# EasyEDA Pro project esp32s3clock.epro, board PCB1
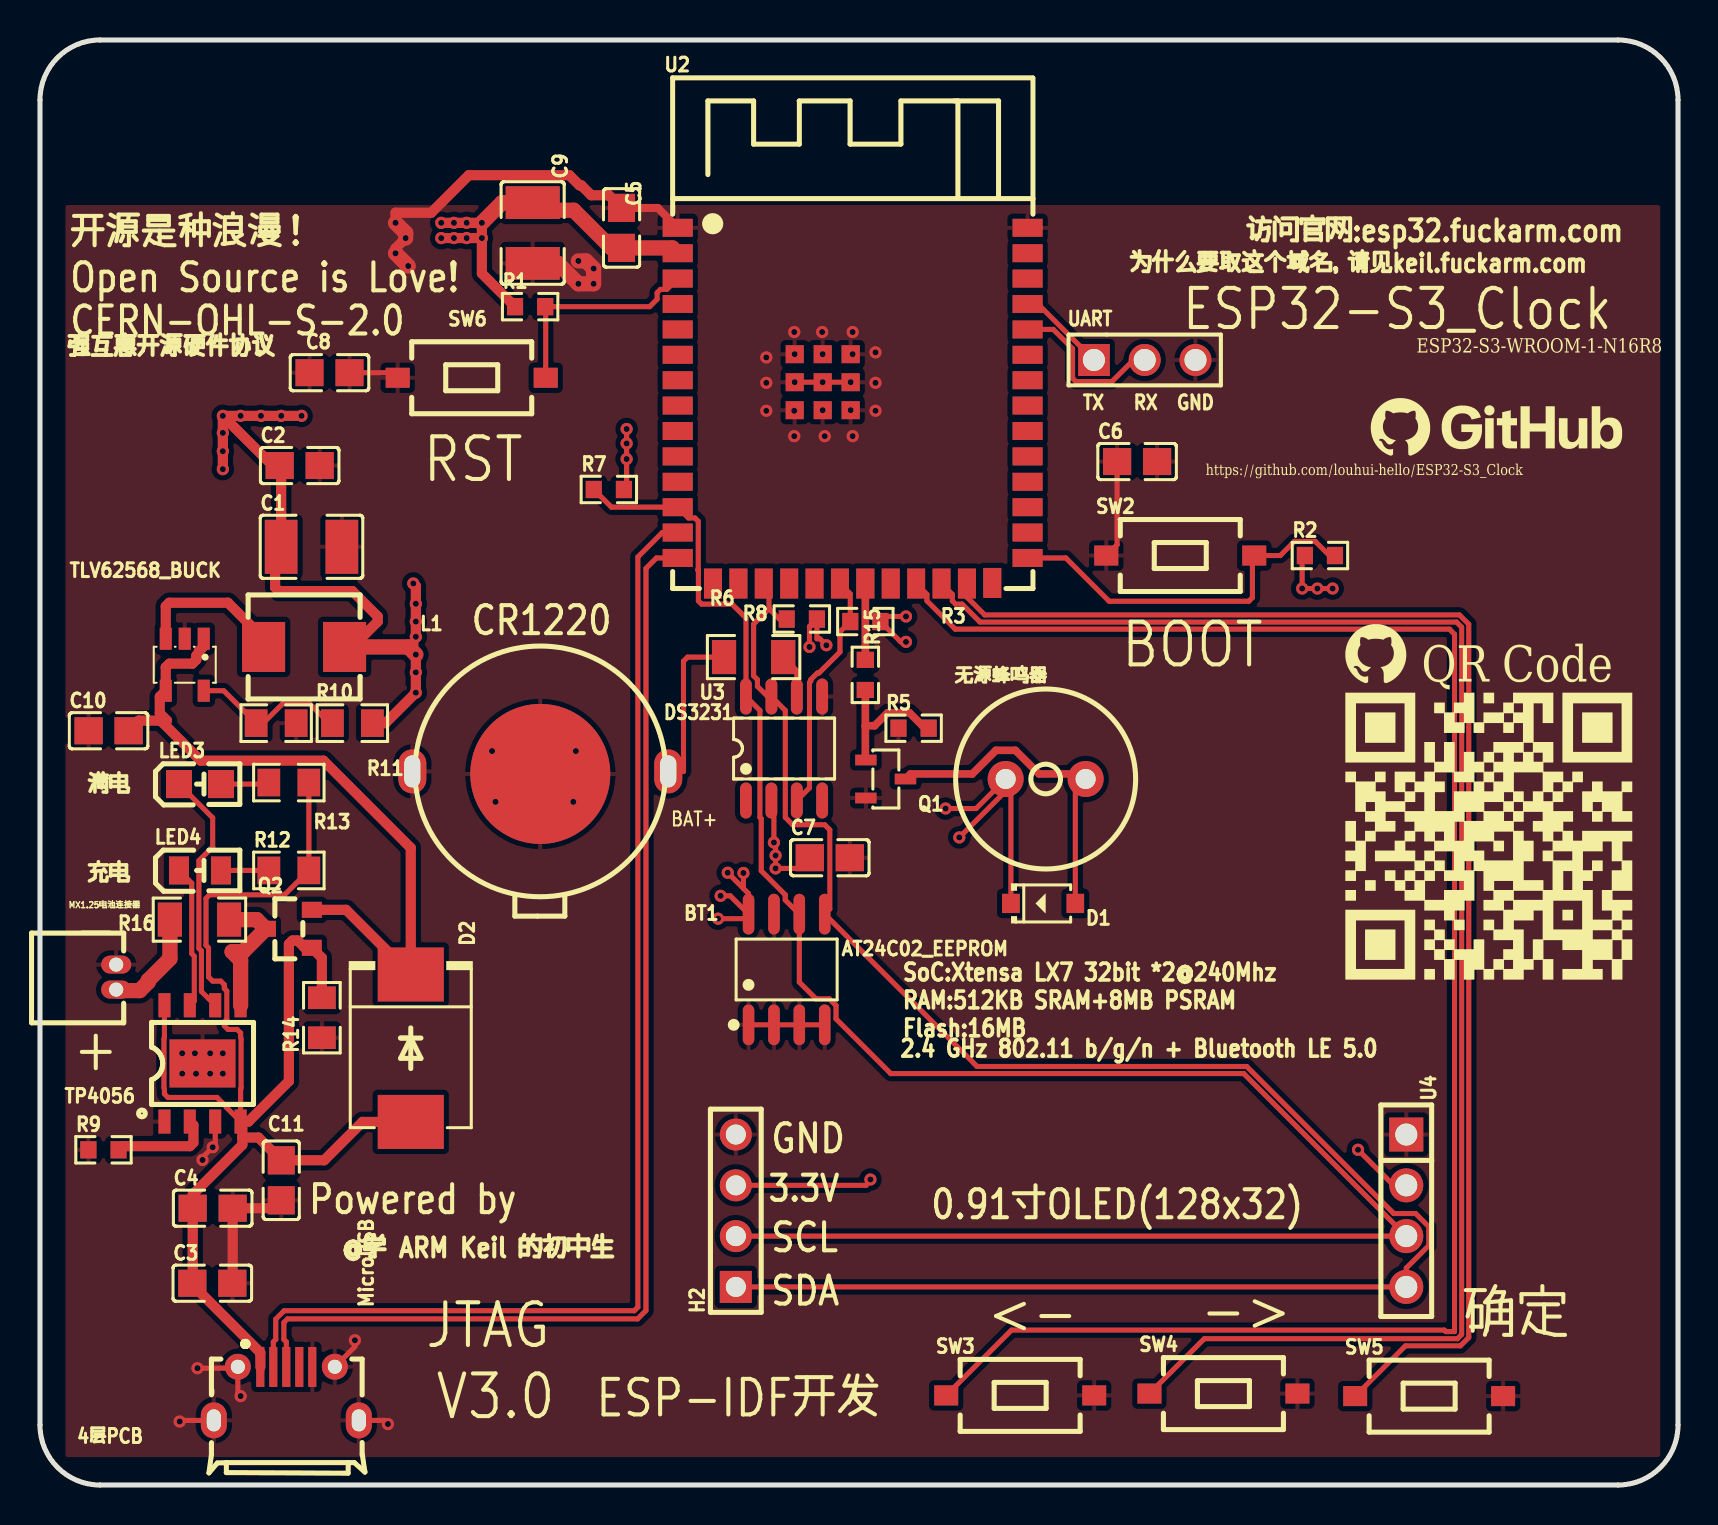
[diagram p5: board, top side]
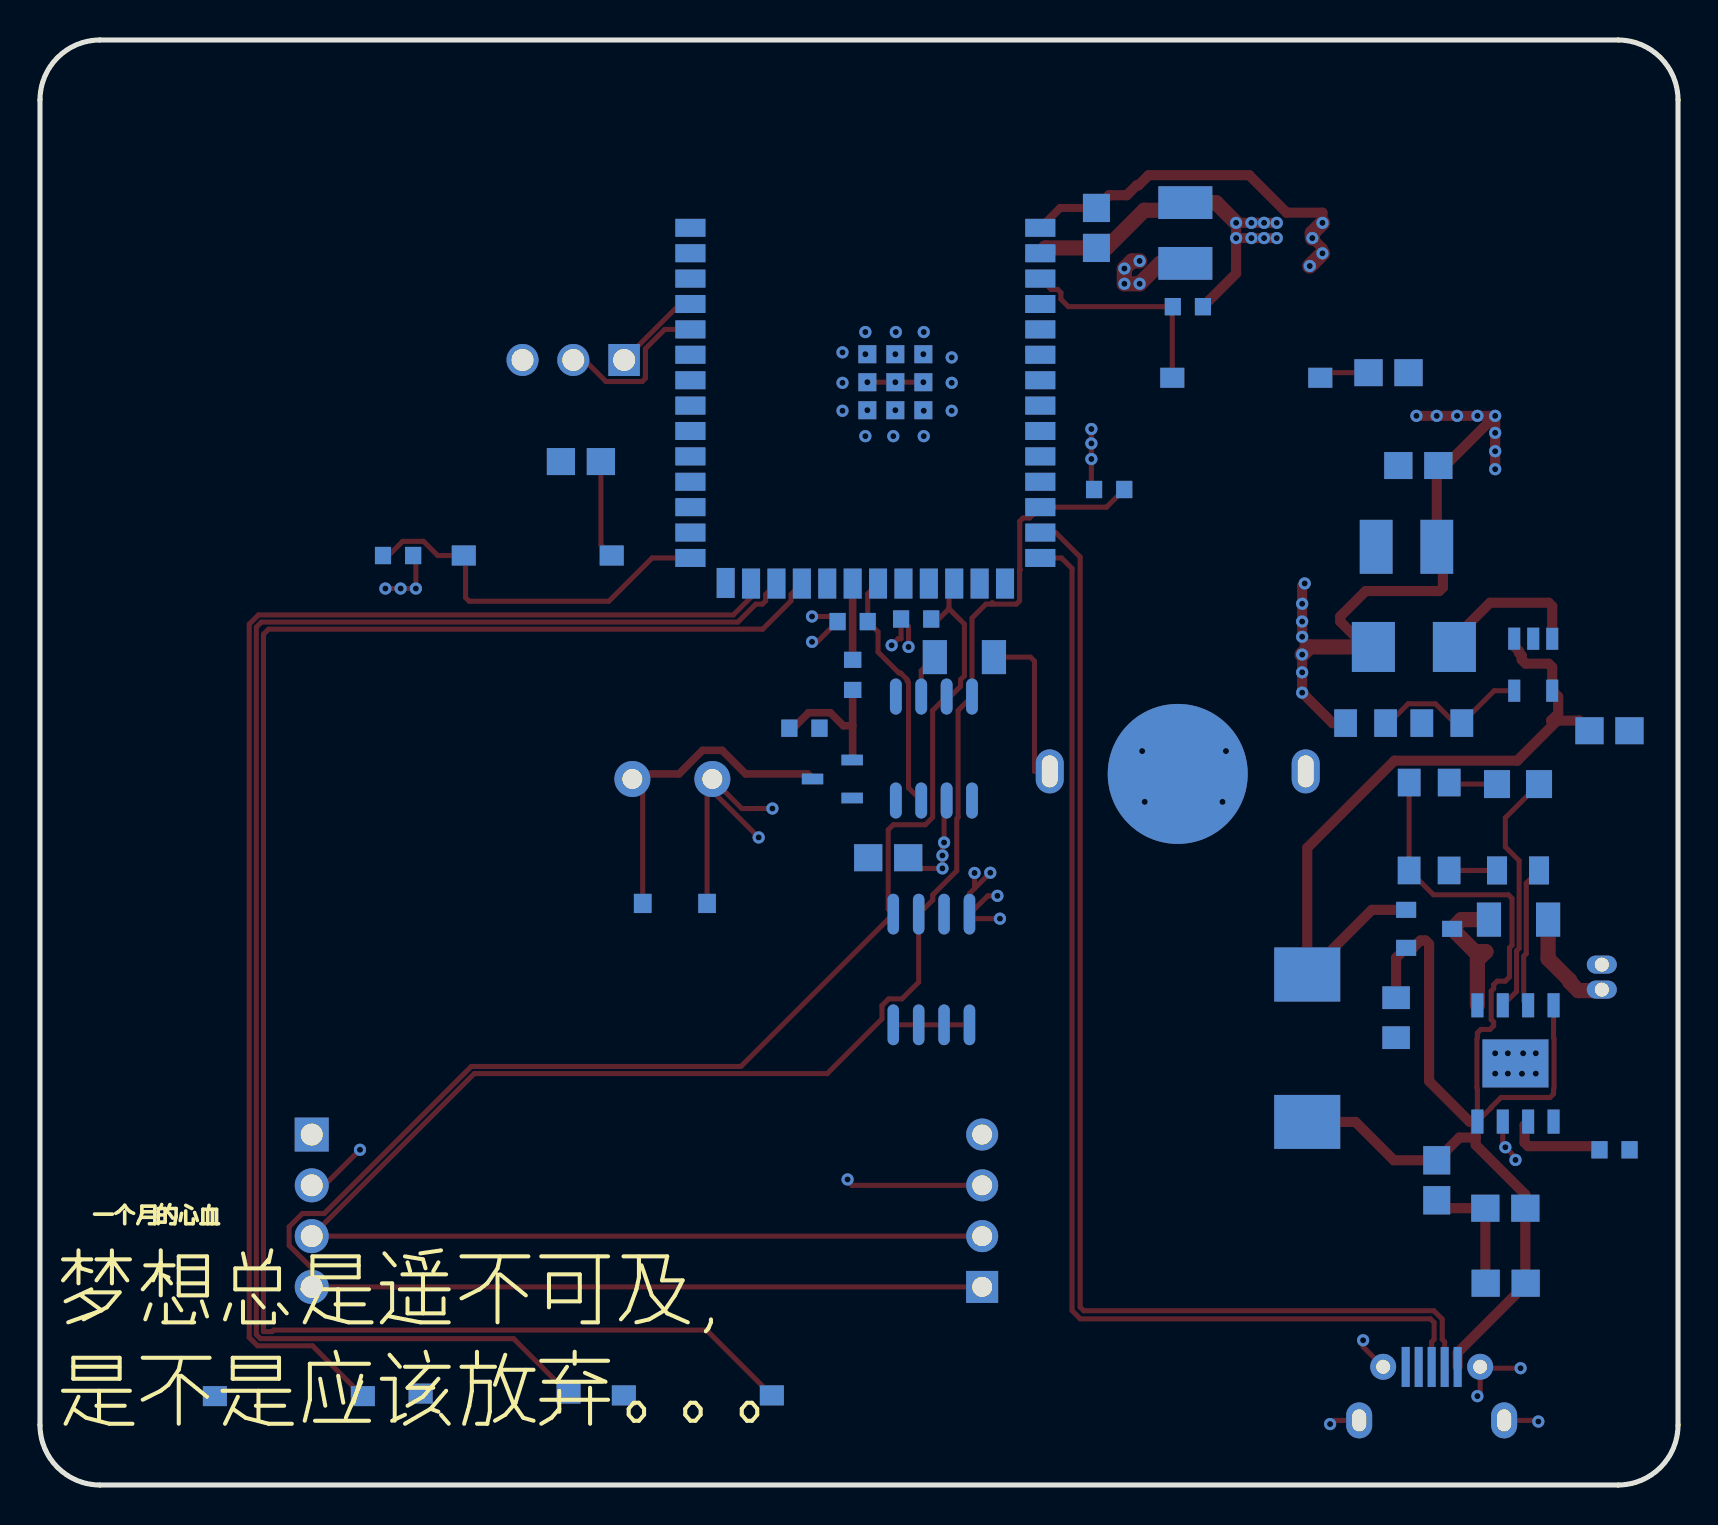
[diagram p6: board, bottom side, seen from below]

Outline 81.91 x 72.26 mm; copper layers: Top Layer, Inner1, Inner2, Bottom Layer. Coordinates in mm from the lower left corner of the outline.
Outline path: 0,69.26 0,3 arc(0.88,0.88) 3,0 78.91,0 arc(81.04,0.88) 81.91,3 81.91,69.26 arc(81.04,71.38) 78.91,72.26 3,72.26 arc(0.88,71.38) 0,69.26
Stack: Top Layer 0.035mm Outer layer thickness 1oz / Dielectric1 0.2104mm 7628 RC49% 8.6mil er 4.4 / Inner1 0.0152mm Inner layer thickness / Dielectric2 1.065mm 1.1mm H/HOZ Copper er 4.43 / Inner2 0.0152mm Inner layer thickness / Dielectric3 0.2104mm 7628 RC49% 8.6mil er 4.4 / Bottom Layer 0.035mm Outer layer thickness 1oz

## Design rules (mm)
net D-: DP1
net D+: DP1
spacing copperThickness1oz (default): track to track 0.102, other pairs 0.152 to 0.3
spacing copperThickness2oz: track to track 0.203, other pairs 0.152 to 0.3
track width copperThickness1oz (default): min 0.127, default 0.254, max 2.54
track width copperThickness2oz: min 0.203, default 0.254, max 2.54
differential pair differentialPair (default): width min 0.127, default 0.254, max 2.54; gap min 0.152, default 0.152
net 3.3V uses copperRegion
net GND uses copperRegion

## Placement (name value [footprint] x y rotation side)
AT24C02_EEPROM  AT24C02  [SOP-8_L5.0-W4.0-P1.27-LS6.0-BL]  37.34 25.78 0 top
BT1  LAIL-CR1220-MO-02  [BAT_TH_LAIL-CR1220-MO-02]  25.02 35.69 180 top
C1  22uF  [C1210]  13.58 46.92 0 top
C2  100nF  [C0805]  12.99 50.98 0 top
C3  22uF  [C0805]  8.62 10.09 0 top
C4  100nF  [C0805]  8.64 13.84 0 top
C5  100nF  [C0805]  29.08 62.86 270 top
C6  100nF  [C0805]  54.86 51.18 0 top
C7  100nF  [C0805]  39.5 31.37 0 top
C8  100nF  [C0805]  14.48 55.63 0 top
C9  22uF  [C1210]  24.64 62.61 270 top
C10  10uF  [C0805]  3.43 37.72 0 top
C11  10uF  [C0805]  12.06 15.24 90 top
D1  1N4148W  [SOD-123_L2.7-W1.6-LS3.7-FD]  50.16 29.08 180 top
D2  SS34  [SMC_L6.9-W5.9-LS7.9-RD]  18.54 21.84 270 top
H1  LAIL-PZ2.54-3P-L  [HDR-TH_3P-P2.54-V-M-1]  55.25 56.26 0 top
H2  LAIL-PZ2.54-4P-L  [CONN-TH_LAIL-PZ2.54-4P-L]  34.8 13.72 90 top
L1  DH0520H-2R2M  [IND-SMD_L5.6-W5.2_MST0530H-150M]  13.21 41.91 180 top
LED3  GL0805UG01  [LED0805-FD_GL0805UG01]  8 35.05 180 top
LED4  GL0805UR01  [LED0805-R-RD_RED]  8 30.73 0 top
MicroUSB  MicroXNJ  [MICRO-USB-SMD_MICROXNJ_1]  12.32 4.57 270 top
MX1.25电池连接器  ZX-MX1.25-2PWZ  [CONN-TH_2P-P1.25_ZX-MX1.25-2PWZ]  3.81 25.4 270 top
NOREF  -  [Pad_e793]  25.02 35.56 0 top
Q1  S8050  [SOT-23-3_L2.9-W1.3-P1.90-LS2.3-BR]  42.29 35.31 180 top
Q2  AO3401A  [SOT-23_L2.9-W1.3-P1.90-LS2.4-BR]  12.45 27.81 0 top
R1  10kΩ  [R0603]  24.51 58.93 0 top
R2  10kΩ  [R0603]  64.01 46.48 0 top
R3  10kΩ  [R0603]  41.28 43.18 180 top
R5  10kΩ  [R0603]  43.69 37.85 0 top
R6  0Ω  [R1206]  35.69 41.4 180 top
R7  4.7kΩ  [R0603]  28.45 49.78 0 top
R8  4.7kΩ  [R0603]  38.1 43.31 0 top
R9  2.4kΩ  [R0603]  3.17 16.76 0 top
R10  100kΩ  [R0805]  15.62 38.1 0 top
R11  22kΩ  [R0805]  11.81 38.1 0 top
R12  1kΩ  [R0805]  12.45 30.73 0 top
R13  1kΩ  [R0805]  12.44 35.13 0 top
R14  100kΩ  [R0805]  14.1 23.37 90 top
R15  1kΩ  [R0603]  41.28 40.51 270 top
R16  0Ω  [R1206]  7.98 28.27 0 top
SW2  TS-1101-C-W  [SW-SMD_L6.0-W3.3-LS8.0_TS-1101-C-W]  57.02 46.48 0 top
SW3  TS-1101-C-W  [SW-SMD_L6.0-W3.3-LS8.0_TS-1101-C-W]  49.02 4.48 0 top
SW4  TS-1101-C-W  [SW-SMD_L6.0-W3.3-LS8.0_TS-1101-C-W]  59.18 4.57 0 top
SW5  TS-1101-C-W  [SW-SMD_L6.0-W3.3-LS8.0_TS-1101-C-W]  69.47 4.44 0 top
SW6  TS-1101-C-W  [SW-SMD_L6.0-W3.3-LS8.0_TS-1101-C-W]  21.59 55.37 0 top
TLV62568_BUCK  TLV62568DBVR  [SOT-23-5_L3.0-W1.7-P0.95-LS2.8-BR]  7.24 41.02 90 top
TP4056  TP4056  [ESOP-8_L4.9-W3.9-P1.27-LS6.0-BL-EP]  8.13 21.08 0 top
U2  2.4GHz  [WIRELM-SMD_ESP32-S3-WROOM-1]  40.64 53.97 0 top
U3  DS3231MZ+TRL  [SOIC-8_L4.9-W3.9-P1.27-LS6.0-BL]  37.21 36.83 0 top
U4  LAIL-PM2.54-4P-L  [HDR-TH_4P-P2.54-V-F]  68.33 13.72 270 top
无源蜂鸣器  2.7kHz  [BUZ-TH_BD9.0-P4.00-D0.6-FD]  50.29 35.31 0 top

## Footprints (pads in the part's own frame, mm; a bottom-side part is the same pattern mirrored in y, then rotated)
BAT_TH_LAIL-CR1220-MO-02
  oval 1.4x2.2 hole 0.8x1.6: 1(-6.4,0) 2(6.4,0)
BUZ-TH_BD9.0-P4.00-D0.6-FD
  round 1.8 hole 1: 1(-2,0) 2(2,0)
C0805
  rect 1.41x1.35 hole 0.001: 1(-1,0) 2(1,0)
C1210
  rect 1.635x2.7 hole 0.001: 1(-1.518,0) 2(1.518,0)
CONN-TH_2P-P1.25_ZX-MX1.25-2PWZ
  oval 0.9x1.5 hole 0.7: 1(-0.625,0) 2(0.625,0)
CONN-TH_LAIL-PZ2.54-4P-L
  rect 1.6x1.6 hole 1: 1(-3.81,0)
  round 1.6 hole 1: 2(-1.27,0) 3(1.27,0) 4(3.81,0)
ESOP-8_L4.9-W3.9-P1.27-LS6.0-BL-EP
  rect 0.6x1.2 hole 0.001: 1(-1.905,-2.909) 2(-0.635,-2.909) 3(0.635,-2.909) 4(1.905,-2.909) 5(1.905,2.909) 6(0.635,2.909) 7(-0.635,2.909) 8(-1.905,2.909)
  rect 3.3x2.4 hole 0.001: 9(0,0)
HDR-TH_3P-P2.54-V-M-1
  rect 1.575x1.6 hole 1.1: 1(-2.54,0)
  round 1.6 hole 1.1: 2(0,0) 3(2.54,0)
HDR-TH_4P-P2.54-V-F
  rect 1.7x1.7 hole 1.1: 1(-3.81,0)
  round 1.7 hole 1.1: 2(-1.27,0) 3(1.27,0) 4(3.81,0)
IND-SMD_L5.6-W5.2_MST0530H-150M
  rect 2.15x2.5 hole 0.001: 1(-2.025,0) 2(2.025,0)
LED0805-FD_GL0805UG01
  rect 1.3x1.399 hole 0.001: 1(-1.05,0) 2(1.05,0)
LED0805-R-RD_RED
  rect 1x1.399 hole 0.001: 1(1.05,0) 2(-1.05,0)
MICRO-USB-SMD_MICROXNJ_1
  rect 2x0.4 hole 0.001: 1(-1.332,-1.3) 2(-1.332,-0.65) 3(-1.332,0) 4(-1.332,0.65) 5(-1.332,1.3)
  round 1.3 hole 0.7: 6(-1.34,2.425) 9(-1.34,-2.425)
  oval 1.8x1.3 hole 1.1x0.7: 7(1.34,3.625) 8(1.34,-3.625)
Pad_e793
  round 7 hole 0.001: TP1(0,0)
R0603
  rect 0.806x0.864 hole 0.001: 1(-0.753,0) 2(0.753,0)
R0805
  rect 1.133x1.377 hole 0.001: 1(-1,0) 2(1,0)
R1206
  rect 1.208x1.701 hole 0.001: 1(-1.479,0) 2(1.479,0)
SMC_L6.9-W5.9-LS7.9-RD
  rect 2.7x3.3 hole 0.001: 1(-3.687,0) 2(3.687,0)
SOD-123_L2.7-W1.6-LS3.7-FD
  rect 0.88x0.96 hole 0.001: 1(-1.61,0) 2(1.61,0)
SOIC-8_L4.9-W3.9-P1.27-LS6.0-BL
  oval 0.588x1.8 hole 0.001: 1(-1.905,-2.6) 2(-0.635,-2.6) 3(0.635,-2.6) 4(1.905,-2.6) 5(1.905,2.6) 6(0.635,2.6) 7(-0.635,2.6) 8(-1.905,2.6)
SOP-8_L5.0-W4.0-P1.27-LS6.0-BL
  oval 0.574x2.035 hole 0.001: 1(-1.905,-2.768) 2(-0.635,-2.768) 3(0.635,-2.768) 4(1.905,-2.768) 5(1.905,2.768) 6(0.635,2.768) 7(-0.635,2.768) 8(-1.905,2.768)
SOT-23-3_L2.9-W1.3-P1.90-LS2.3-BR
  rect 1.07x0.532 hole 0.001: 1(0.99,-0.95) 2(0.99,0.95) 3(-0.99,0)
SOT-23-5_L3.0-W1.7-P0.95-LS2.8-BR
  rect 1.1x0.6 hole 0.001: 1(1.3,-0.95) 2(1.3,0) 3(1.3,0.95) 4(-1.3,0.95) 5(-1.3,-0.95)
SOT-23_L2.9-W1.3-P1.90-LS2.4-BR
  rect 1x0.8 hole 0.001: 1(1.15,-0.95) 2(1.15,0.95) 3(-1.15,0)
SW-SMD_L6.0-W3.3-LS8.0_TS-1101-C-W
  rect 1.2x1 hole 0.001: 1(-3.7,0) 2(3.7,0)
WIRELM-SMD_ESP32-S3-WROOM-1
  rect 1.5x0.9 hole 0.001: 1(-8.75,8.895) 2(-8.75,7.625) 3(-8.75,6.355) 4(-8.75,5.085) 5(-8.75,3.815) 6(-8.75,2.545) 7(-8.75,1.275) 8(-8.75,0.005) 9(-8.75,-1.265) 10(-8.75,-2.535) 11(-8.75,-3.805) 12(-8.75,-5.075) 13(-8.75,-6.345) 14(-8.75,-7.615) 27(8.75,-7.615) 28(8.75,-6.345) 29(8.75,-5.075) 30(8.75,-3.805) 31(8.75,-2.535) 32(8.75,-1.265) 33(8.75,0.005) 34(8.75,1.275) 35(8.75,2.545) 36(8.75,3.815) 37(8.75,5.085) 38(8.75,6.355) 39(8.75,7.625) 40(8.75,8.895)
  rect 0.9x1.5 hole 0.001: 15(-6.985,-8.895) 16(-5.715,-8.895) 17(-4.445,-8.895) 18(-3.175,-8.895) 19(-1.905,-8.895) 20(-0.635,-8.895) 21(0.635,-8.895) 22(1.905,-8.895) 23(3.175,-8.895) 24(4.445,-8.895) 25(5.715,-8.895) 26(6.985,-8.865)
  rect 0.9x0.9 hole 0.001: 41(-2.9,2.575) 41(-2.9,1.175) 41(-2.9,-0.225) 41(-1.5,2.575) 41(-1.5,1.175) 41(-1.5,-0.225) 41(-0.1,2.575) 41(-0.1,1.175) 41(-0.1,-0.225)

## Nets
As in the schematic, except:
GND: AT24C02_EEPROM.1 AT24C02_EEPROM.2 AT24C02_EEPROM.3 AT24C02_EEPROM.4 AT24C02_EEPROM.7 BT1.2 C1.2 C2.2 C3.2 C4.2 C5.1 C6.1 C6.2 C7.2 C8.1 C8.2 C9.2 C10.1 C11.1 H1.3 H2.4 MicroUSB.5 MicroUSB.6 MicroUSB.7 MicroUSB.8 MicroUSB.9 MX1.25电池连接器.1 NOREF.TP1 Q1.2 R5.1 R9.1 R11.2 R14.1 SW2.1 SW3.2 SW4.2 SW5.2 SW6.1 TLV62568_BUCK.2 TP4056.1 TP4056.3 TP4056.9 U2.1 U2.40 U2.41 U3.5 U4.1

Pads without a net: MicroUSB 4; U2 4 5 6 7 8 9 10 11 15 16 18 19 22 26 28 29 30 31 32 33 34 35 38 39; U3 1 4

## Via types
v1: diameter 0.61, hole 0.305, Top Layer to Bottom Layer, 92 vias

## Routing (per net, layer and track width the routed paths; a pad name or vN(x,y) marks a point on that pad's centre or on a via; arc(x,y) is an arc through that point)
3.3V: length 105.2
  Top Layer w0.254: 无源蜂鸣器.1 48.29,34.7 v1(45.97,32.39) ; 无源蜂鸣器.1 46.82,33.83 v1(45.29,33.83) ; 无源蜂鸣器.1 48.56,35.04 D1.2 ; v1(29.34,52.81) v1(29.34,52.09) v1(29.34,51.31) 29.34,49.92 R7.2 ; v1(43.31,42.16) 43.04,42.16 R3.1 42.28,43.43 v1(43.31,43.43) ; 68.33,14.99 67.69,14.99 v1(65.91,16.76) ; v1(64.64,44.83) v1(63.88,44.83) v1(63.12,44.83) 63.12,46.35 R2.1 ; v1(33.91,28.32) 35.21,28.32 AT24C02_EEPROM.8 ; v1(34.04,29.46) 34.52,29.46 AT24C02_EEPROM.8 ; 35.18,29.83 35.43,29.58 AT24C02_EEPROM.8 ; 35.18,29.83 v1(35.18,30.61) ; 35.18,29.83 v1(34.39,30.62) ; C7.1 37.96,30.84 v1(36.79,30.84) v1(36.79,31.48) 36.79,32.05 v1(36.7,32.13) 36.7,34.1 36.58,34.23 ; v1(38.48,41.91) 38.48,42.93 R8.2 38.85,42.32 39,42.32 v1(39.33,41.99) ; v1(41.53,15.28) 41.53,15.21 41.31,14.99 34.8,14.99 ; v1(18.8,42.42) v1(18.8,41.53)
  Top Layer w0.508: v1(18.8,42.42) v1(18.8,43.18) v1(18.8,44.07) 18.8,44.96 v1(18.67,45.08) ; R10.2 17.27,38.1 v1(18.8,39.62) v1(18.8,40.64) v1(18.8,41.53) ; v1(9.14,53.47) v1(9.14,52.62) v1(9.14,51.7) v1(9.14,50.8) ; v1(9.14,53.47) 11.63,50.98 C2.1 12.06,50.91 C1.1 11.76,46.61 11.76,44.88 11.94,44.7 15.62,44.7 16.89,43.43 16.89,43.18 15.62,41.91 L1.1 ; v1(9.14,53.47) v1(10.03,53.47) v1(11.05,53.47) v1(12.06,53.47) v1(13.08,53.47) ; v1(20.07,62.36) v1(20.7,62.36) v1(21.34,62.36) v1(22.1,62.36) ; v1(22.1,62.36) 22.1,60.59 R1.1 ; v1(22.1,62.36) v1(22.1,63.12) v1(21.34,63.12) v1(20.7,63.12) v1(20.07,63.12)
  Top Layer w0.762: v1(22.1,63.12) 23.11,64.13 C9.1 25.02,63.75 26.69,63.75 28.57,61.86 C5.2 31.62,61.86 U2.2 ; 15.62,41.91 18.42,41.91 v1(18.8,41.53)
GND: length 56.7
  Top Layer w0.254: AT24C02_EEPROM.4 AT24C02_EEPROM.3 AT24C02_EEPROM.2 AT24C02_EEPROM.1 ; v1(17.4,3.05) 17.22,3.23 MicroUSB.7 ; v1(9.14,20.57) v1(9.14,21.59) ; v1(40.54,55.15) v1(39.14,55.15) v1(37.74,55.15) ; v1(7.87,5.84) 9.82,5.84 MicroUSB.9 9.89,4.58 v1(10.03,4.44) ; v1(6.98,3.18) 7.04,3.23 MicroUSB.8 ; v1(8.13,16.26) 8.13,16.38 v1(8.64,16.89) 8.76,17.02 TP4056.3 ; SW6.1 17.64,55.63 C8.2 ; SW2.1 53.86,47.02 C6.1 ; v1(15.75,7.24) 15.75,6.92 MicroUSB.6
  Top Layer w0.4: C5.1 30.9,63.86 31.89,62.87
  Top Layer w0.508: v1(18.29,62.36) 17.78,61.85 v1(17.78,61.59) ; v1(17.78,63.12) 17.78,63.63 19.57,63.63 21.44,65.5 26.47,65.5 26.98,64.99 27.07,64.99 27.56,64.5 28.45,64.5 C5.1 ; C3.2 9.64,10.11 C4.2 11.67,13.84 C11.1
  Top Layer w0.762: v1(18.29,62.36) 18.29,62.61 v1(17.78,63.12) ; C9.2 25.9,61.09 v1(26.92,60.07) v1(27.69,60.07) v1(27.69,60.83) 27.31,61.21 v1(26.92,61.21) ; v1(17.78,61.59) v1(18.42,60.96)
  vias: v1(7.11,21.59) v1(7.11,20.57) v1(7.75,21.59) v1(7.8,20.57) v1(8.51,21.59) v1(8.51,20.57) v1(22.61,36.7) v1(22.78,34.16) v1(26.67,34.16) v1(26.8,36.7) v1(36.32,56.39) v1(36.32,55.12) v1(36.32,53.72) v1(37.72,57.66) v1(37.74,56.55) v1(37.72,53.72) v1(37.72,52.45) v1(39.12,57.66) v1(39.14,56.55) v1(39.14,53.75) v1(39.24,52.45) v1(40.54,53.75) v1(40.64,57.66) v1(40.64,56.55) v1(40.64,52.45) v1(41.78,56.64) v1(41.78,55.12) v1(41.78,53.72)
VBUS: length 70.1
  Top Layer w0.254: TP4056.8 6.22,22.39 arc(6.21,22.34) 6.2,22.28 6.2,19.88 arc(6.21,19.82) 6.22,19.77 6.22,19.56 6.4,19.38 8.85,19.38 9.34,18.89 9.34,18.86 TP4056.4 10.03,19.77 arc(10.05,19.82) 10.06,19.88 10.06,22.28 arc(10.05,22.34) 10.03,22.39 10.03,22.61 9.85,22.79 9.4,22.79 9.22,22.97 9.22,23.15 9.34,23.27 9.34,24.71 9.22,24.83 9.22,25.02 9.04,25.2 8.64,25.2 8.43,25.41 8.43,26.86 8.3,26.99 8.3,29.34 8.48,29.52 12.23,29.52 R12.2 13.45,35.13 R13.2
  Top Layer w0.508: 10.12,17.38 10.12,17.01 7.64,14.53 C4.1 7.64,10.11 C3.1 7.62,10.02 11.02,6.62 MicroUSB.1 ; 10.12,17.38 10.93,17.38 C11.2 14.21,16.24 16.13,18.16 D2.2 ; 10.12,17.38 10.12,18.09 TP4056.4 10.43,18.17 12.45,20.19 12.45,27.05 12.63,27.23 12.88,27.23 13.25,26.86 Q2.1 14.1,26.36 R14.2
VIN: length 35.7
  Top Layer w0.508: C10.2 4.94,38.23 6.03,38.23 ; 6.03,38.23 8.04,36.22 14.18,36.22 18.54,31.86 D2.1 15.31,28.76 Q2.2 ; 6.03,38.23 6.35,38.23 5.99,38.59 5.99,39.42 TLV62568_BUCK.4 6.29,40.89 6.47,41.07 7.62,41.07 7.82,41.27 7.82,41.48 7.95,41.6 7.95,41.7 8.19,41.94 TLV62568_BUCK.1
BAT_IN: length 2.3
  Top Layer w0.254: R6.1 37.85,40.72 37.85,39.43
BAT_OUT: length 8.4
  Top Layer w0.254: BT1.1 32.18,35.69 32.18,41.2 32.38,41.4 R6.2
BOOT: length 19
  Top Layer w0.254: R2.2 64.48,46.48 63.77,47.19 62.74,47.19 62.03,46.48 SW2.2 60.63,46.39 60.63,44.38 60.45,44.2 53.47,44.2 51.3,46.36 U2.27
BUZZER: length 16.6
  Top Layer w0.254: 无源蜂鸣器.2 51.78,34.79 D1.1
  Top Layer w0.381: Q1.3 43.53,35.56 46.62,35.56 47.8,36.74 48.78,36.74 49.96,35.56 52.04,35.56 无源蜂鸣器.2
BUZZER_PWM: length 7.3
  Top Layer w0.381: Q1.1 41.28,36.28 41.28,37.97 ; 41.28,37.97 41.74,37.97 42.39,38.62 43.48,38.62 44.13,37.97 44.32,37.97 R5.2 ; 41.28,37.97 R15.2
D+: length 59.5
  Top Layer w0.254: MicroUSB.3 12.32,7.16 12.2,7.28 12.2,8.13 12.38,8.31 29.89,8.31 30.3,8.73 30.3,45.84 30.83,46.36 U2.14
D-: length 60.8
  Top Layer w0.254: MicroUSB.2 11.67,7.16 11.79,7.28 11.79,8.3 12.21,8.71 29.72,8.71 29.9,8.89 29.9,46.41 31.12,47.63 U2.13
DS_WAKE_UP_GPIO12: length 12.2
  Top Layer w0.254: U2.20 40.52,44.56 R3.2 40,42.66 40,41.66 38.96,40.61 38.88,40.61 38.54,40.27 38.54,40.19 38.48,40.13 38.48,34.86 U3.3
FB: length 7.9
  Top Layer w0.254: TLV62568_BUCK.5 9.19,39.72 R11.1 11.16,38.1 12.13,39.07 13.49,39.07 14.46,38.1 R10.1
KEY_ENTER: length 68.9
  Top Layer w0.254: SW5.1 68.28,6.96 71.03,6.96 71.45,7.38 71.45,43.05 70.99,43.51 47.24,43.51 46.35,44.4 U2.25
KEY_LEFT: length 89.8
  Top Layer w0.254: SW3.1 48.58,7.75 70.23,7.75 70.31,7.67 70.74,7.67 70.74,42.55 70.49,42.8 45.77,42.8 44.36,44.21 44.36,44.54 U2.23
KEY_RIGHT: length 79.3
  Top Layer w0.254: SW4.1 58.23,7.32 70.89,7.32 71.09,7.53 71.09,42.9 70.84,43.16 47.01,43.16 46.11,44.05 45.79,44.05 45.63,44.21 45.63,44.54 U2.24
LED: length 7.2
  Top Layer w0.254: LED4.2 7.59,30.1 7.59,26.57 7.72,26.45 7.72,24.21 TP4056.7
LED1: length 12.4
  Top Layer w0.254: TP4056.6 8.07,24.68 8.07,26.71 7.95,26.84 7.95,31.22 8.64,31.91 8.64,33.37 LED3.2
LED_VCC: length 2.4
  Top Layer w0.254: LED4.1 R12.1
LED_VCC1: length 2.4
  Top Layer w0.254: LED3.1 11.37,35.05 R13.1
POWER_BAT_IN: length 7.1
  Top Layer w0.762: TP4056.5 10.03,26.24 9.61,26.67 10.15,26.67 Q2.3 10.83,28.27 R16.2
POWER_BAT_IN_RAW: length 5.4
  Top Layer w0.762: R16.1 6.5,26.32 5.41,25.23 5.41,25.15 4.98,24.72 3.86,24.72 MX1.25电池连接器.2
RST: length 11
  Top Layer w0.254: SW6.2 25.29,58.9 R1.2 30.49,58.93 30.86,59.3 30.86,59.63 31.02,59.79 31.35,59.79 U2.3
RX: length 8.2
  Top Layer w0.254: H1.2 54.69,56.26 53.61,55.18 51.8,55.18 51.64,55.35 51.64,56.82 50.67,57.79 49.39,57.79
SCL: length 101.5
  Top Layer w0.254: R7.1 28.58,48.9 U2.12 32.43,48.36 32.76,48.36 32.92,48.2 32.92,45.79 32.89,45.77 32.93,45.74 32.93,44.21 33.09,44.05 34.22,44.05 34.29,44.12 34.36,44.05 34.61,44.05 35.31,43.36 35.31,39.43 36,38.73 36,33.39 36.07,33.32 36.07,30.72 37.27,29.51 37.27,29.25 AT24C02_EEPROM.6 37.97,25.15 38.81,24.31 39.48,24.31 39.81,23.98 39.81,23.31 42.54,20.57 60.2,20.57 U4.3 H2.2
SDA: length 94.5
  Top Layer w0.254: 36.46,43.82 36.46,44.82 U2.17 ; 36.46,43.82 35.69,43.05 35.69,40.47 35.88,40.27 35.88,39.94 36.39,39.43 36.58,39.43 37.27,38.73 37.27,33.39 37.64,33.02 39.24,33.02 39.5,32.77 39.5,28.8 AT24C02_EEPROM.5 46.86,20.93 60.35,20.93 67.7,13.58 68.79,13.58 69.46,12.91 69.46,11.98 68.33,10.85 U4.4 H2.1 ; 36.46,43.82 36.97,43.31 R8.1
TX: length 4.5
  Top Layer w0.254: U2.37 49.91,59.06 H1.1
$1N15: length 5
  Top Layer w0.508: TP4056.2 7.67,17.99 7.67,17.12 7.49,16.94 4.11,16.94 R9.2
$2N149: length 3.8
  Top Layer w0.381: U2.21 R15.1
$2N176: length 7.8
  Top Layer w0.508: TLV62568_BUCK.3 6.29,43.94 6.47,44.12 9.4,44.12 11.18,42.34 L1.2

## Copper pours and planes (outline as drawn; the poured copper is in the pictures)
3.3V on Inner2: 1.2,64.5 80.9,64.5 80.9,1.27 1.2,1.27
GND on Top Layer: 1.27,64.01 81.03,64.01 81.03,1.4 1.27,1.4
GND on Inner1: 1.27,64.5 80.77,64.5 80.77,1.27 1.27,1.27
GND on Inner1: 1.78,64.52 80.77,64.52 80.77,1.65 1.78,1.65

## Text on the board
Bottom Silkscreen Layer: 一个月的心血 | 梦想总是遥不可及, / 是不是应该放弃。。。
Top Silkscreen Layer: BAT+ | DS3231 | UART | TX | RX | GND | 2.4 GHz 802.11 b/g/n + Bluetooth LE 5.0 | SoC:Xtensa LX7 32bit *2@240Mhz | RAM:512KB SRAM+8MB PSRAM | Flash:16MB | 3.3V | CERN-OHL-S-2.0 | Powered by | CR1220 | SCL | SDA | ESP32-S3_Clock | - | + | RST | JTAG | V3.0 | <- | BOOT | -> | https://github.com/louhui-hello/ESP32-S3_Clock | ESP32-S3-WROOM-1-N16R8 | QR Code | 0.91寸OLED(128x32) | 开源是种浪漫！ / Open Source is Love! | 4层PCB | 满电 | 充电 | 为什么要取这个域名，请见keil.fuckarm.com | 强互惠开源硬件协议 | @学 ARM Keil 的初中生 | 访问官网:esp32.fuckarm.com | ESP-IDF开发 | 确定
